# Altium schematic sheet LED-PCB.SchDoc
size A; SheetNumber: 1; SheetTotal: 1
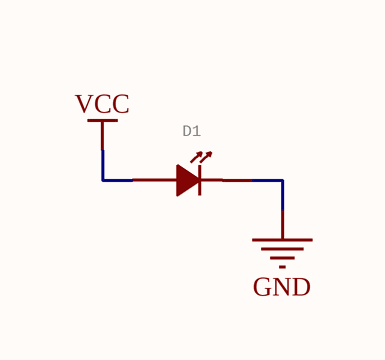
[diagram p0: LED-PCB.SchDoc]

## Parts
D1  OSRAM SFH 4715B, 850 nm infrared emitter Pin 1 cathode; pin 2 anode. Package SFH4715B, max component height 2.29 mm.  [SFH4715B]  (value not drawn)

## Nets
GND: D1.1
VCC: D1.2

## Library data of the parts
D1 = SFH4715B: MANUFACTURER: ams OSRAM; GateName_1: G$1; PACKAGE_DRAWING: C63062-A4141-A1...-12; SymbolName_1: SFH4715B; LibraryName: OSRAM_SFH4715B_Altium_Import_v3; DeviceSetName: SFH4715B; Package: SFH4715B; MPN: SFH 4715B; DATASHEET_LAND_PATTERN: E062.3010.91-06